# Altium schematic sheet TPS259474LRPWR.schdoc
size 127 x 101 mm
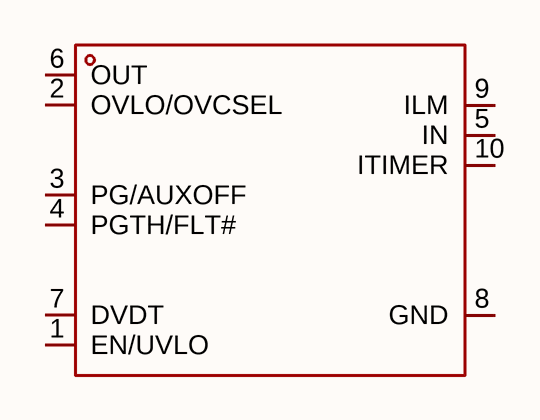
[diagram p0: TPS259474LRPWR.schdoc]

## Parts
U?  tps259474lrpwr  [VQFN-10_L2.0-W2.0-P0.45-TL]  (value not drawn)

## Nets

Not connected (* = marked no-connect by the designer): U? 1(EN/UVLO) 2(OVLO/OVCSEL) 3(PG/AUXOFF) 4(PGTH/FLT#) 5(IN) 6(OUT) 7(DVDT) 8(GND) 9(ILM) 10(ITIMER)

## Library data of the parts
U? = tps259474lrpwr: 通道数:1;工作电压:2.7V~23V;安装方式:表面安装;; Manufacturer: TI(德州仪器); AddInBom: yes; ModelId: c74b11dc6301497d8044a28629695f2c; ModelTransform: 79.1337,78.74,0,0,0,0,0,0,0; FET Type: 内置FET; Number of Lines: 1; Trigger Current: 500mA~6A; RDS(on): 45mΩ; LCSC Part Name: 2.7V至23V、5.5A、28mΩ真反向电流阻断电子保险丝; SupplierPart: C2864845; ManufacturerPart: TPS259474LRPWR; Supplier Footprint: VQFN-10-HR(2x2); JLCPCB Part Class: Extended Part; Datasheet: https://www.ti.com/cn/lit/ds/symlink/tps25947.pdf; Supplier: LCSC; ConvertToPcb: yes; SymbolName: TPS259474LRPWR; FootprintName: VQFN-10_L2.0-W2.0-P0.45-TL; ModelName: VQFN-10_L2.0-W2.0-P0.45-TL; Threshold Voltage: -; Voltage Rating: 2.7V~23V; Reset Voltage: -; Mounting Type: 表面安装; Peak Output Current(Source): -; Peak Output Current(Sink): -; Operating temperature: -40℃~+125℃; Length: 2mm; Width: 2mm; Height: 1mm; Features: 热保护；过流保护；过压钳位保护；欠压锁定；短路保护